# Altium schematic sheet led_cc_driver_ir.SchDoc
size 297 x 209 mm
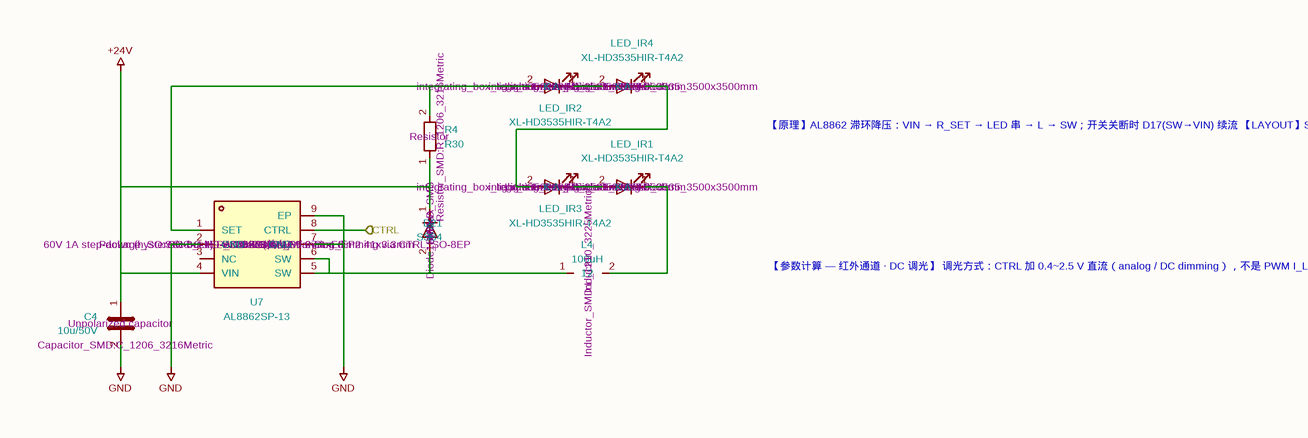
[diagram p0: led_cc_driver_ir.SchDoc]

## Parts
C4  Description: Unpolarized capacitor  Footprint: Capacitor_SMD:C_1206_3216Metric  [C_1206_3216Metric]  (hidden comment: 10u/50V)
D21  Description: Diode  Sim.Pins: 1=K 2=A  Footprint: Diode_SMD:D_SMB  [D_SMB]  (hidden comment: SS34)
L4  Description: Inductor  Footprint: Inductor_SMD:L_1210_3225Metric  [L_1210_3225Metric]  (hidden comment: 100uH)
LED_IR1  Description: Light emitting diode  Sim.Pins: 1=K 2=A  LCSC Part: C5221244  Footprint: integrating_box_light_source:LED_3535_3500x3500mm  [LED_3535_3500x3500mm]  (hidden comment: XL-HD3535HIR-T4A2)
LED_IR2  Description: Light emitting diode  Sim.Pins: 1=K 2=A  LCSC Part: C5221244  Footprint: integrating_box_light_source:LED_3535_3500x3500mm  [LED_3535_3500x3500mm]  (hidden comment: XL-HD3535HIR-T4A2)
LED_IR3  Description: Light emitting diode  Sim.Pins: 1=K 2=A  LCSC Part: C5221244  Footprint: integrating_box_light_source:LED_3535_3500x3500mm  [LED_3535_3500x3500mm]  (hidden comment: XL-HD3535HIR-T4A2)
LED_IR4  Description: Light emitting diode  Sim.Pins: 1=K 2=A  LCSC Part: C5221244  Footprint: integrating_box_light_source:LED_3535_3500x3500mm  [LED_3535_3500x3500mm]  (hidden comment: XL-HD3535HIR-T4A2)
R4  Description: Resistor  Footprint: Resistor_SMD:R_1206_3216Metric  [R_1206_3216Metric]  (hidden comment: R30)
U7  Description: 60V 1A step-down (hysteretic buck) LED driver, PWM/analog dimming via CTRL, SO-8EP  LCSC Part: C526360  Manufacturer: DIODES(美台)  Package: SO-8_L4.9-W3.9-P1.27-LS6.0-BL-EP  Footprint: Package_SO:SOIC-8-1EP_3.9x4.9mm_P1.27mm_EP2.41x3.3mm  [SOIC-8-1EP_3.9x4.9mm_P1.27mm_EP2.41x3.3mm]  (hidden comment: AL8862SP-13)

## Ports
CTRL (in)

## Nets
+24V: C4.1 D21.1(K) R4.1 U7.4(VIN)
GND: C4.2 U7.2(GND) U7.7(GND) U7.9(EP)
CTRL: U7.8(CTRL) ; port CTRL
NetD21_2: D21.2(A) L4.1 U7.5(SW) U7.6(SW)
NetL4_2: L4.2 LED_IR1.1(K)
NetLED_IR1_2: LED_IR1.2(A) LED_IR3.1(K)
NetLED_IR2_1: LED_IR2.1(K) LED_IR4.2(A)
NetLED_IR2_2: LED_IR2.2(A) R4.2 U7.1(SET)
NetLED_IR3_2: LED_IR3.2(A) LED_IR4.1(K)

Not connected (* = marked no-connect by the designer): U7 3(NC)

## Notes on the sheet
- 【原理】AL8862 滞环降压：VIN → R_SET → LED 串 → L → SW；开关关断时 D17(SW→VIN) 续流
  【LAYOUT】SW→L/D 走线最短以降低 EMI；EP 大面积铺铜 + 散热过孔；R_SET 与 VIN/SET 用 Kelvin 接法
  【焊接】3535 灯珠回流焊 240±5℃/6s，只建议返修时手工焊（<300℃/3s）
- 【参数计算 — 红外通道 · DC 调光】
  调光方式：CTRL 加 0.4~2.5 V 直流（analog / DC dimming），不是 PWM
  I_LED(100%) = 0.1/0.30 = 333 mA；ΔI = 26 mV/R_SET = 86.6 mA（VSET_HYS = ±13%，固定值）
  V_LED = 4×1.55 V = 6.2 V
  t_OFF = 100µ×86.6m/(6.2+0.5+0.13) = 1268 ns
  t_ON = 8.66µ/(24−6.2−0.13) = 487 ns → f_SW = 570 kHz（满载 CCM）
  红外灯珠 Vf 温漂较大（约 −3 mV/K）：低温时 V_LED 略升，仍远低于 24 V 母线
- 1
- 2
- 3
- 4
- 5
- 6
- A
- B
- C
- 通道：红外 850nm / 4 颗 3535 串联
- IC：AL8862SP-13 (LCSC C526360)
- 灯珠：XL-HD3535HIR-T4A2 (LCSC C5221244)
- D
- Title: LED 恒流驱动 — 红外通道
- File: led_cc_driver_ir.kicad_sch
- Sheet: /
- integrating_box_light_source
- KiCad E.D.A.  kicad (5.1.4)-1
- Size: A4
- Date: 2026-11-08
- Rev: A
- Id: 1/1

## Library data of the parts
C4 = C: Value: 10u/50V
D21 = D: Sim.Device: D; Value: SS34
L4 = L: Value: 100uH
LED_IR1-LED_IR4 = LED: Value: XL-HD3535HIR-T4A2
R4 = R: Value: R30
U7 = AL8862SP-13: MPN: AL8862SP-13; Value: AL8862SP-13